# EasyEDA Pro project bike-tp.eprj

# Schematic Schematic1

## Sheets
1 P1: Board Name: Board1; Create Date: 2024-08-08; Page Name: P1; Project Name: bike-tp; Schematic Name: Schematic1; Update Date: 2025-05-04; Company: 嘉立创EDA; Page Size: A4; Version: V1.0
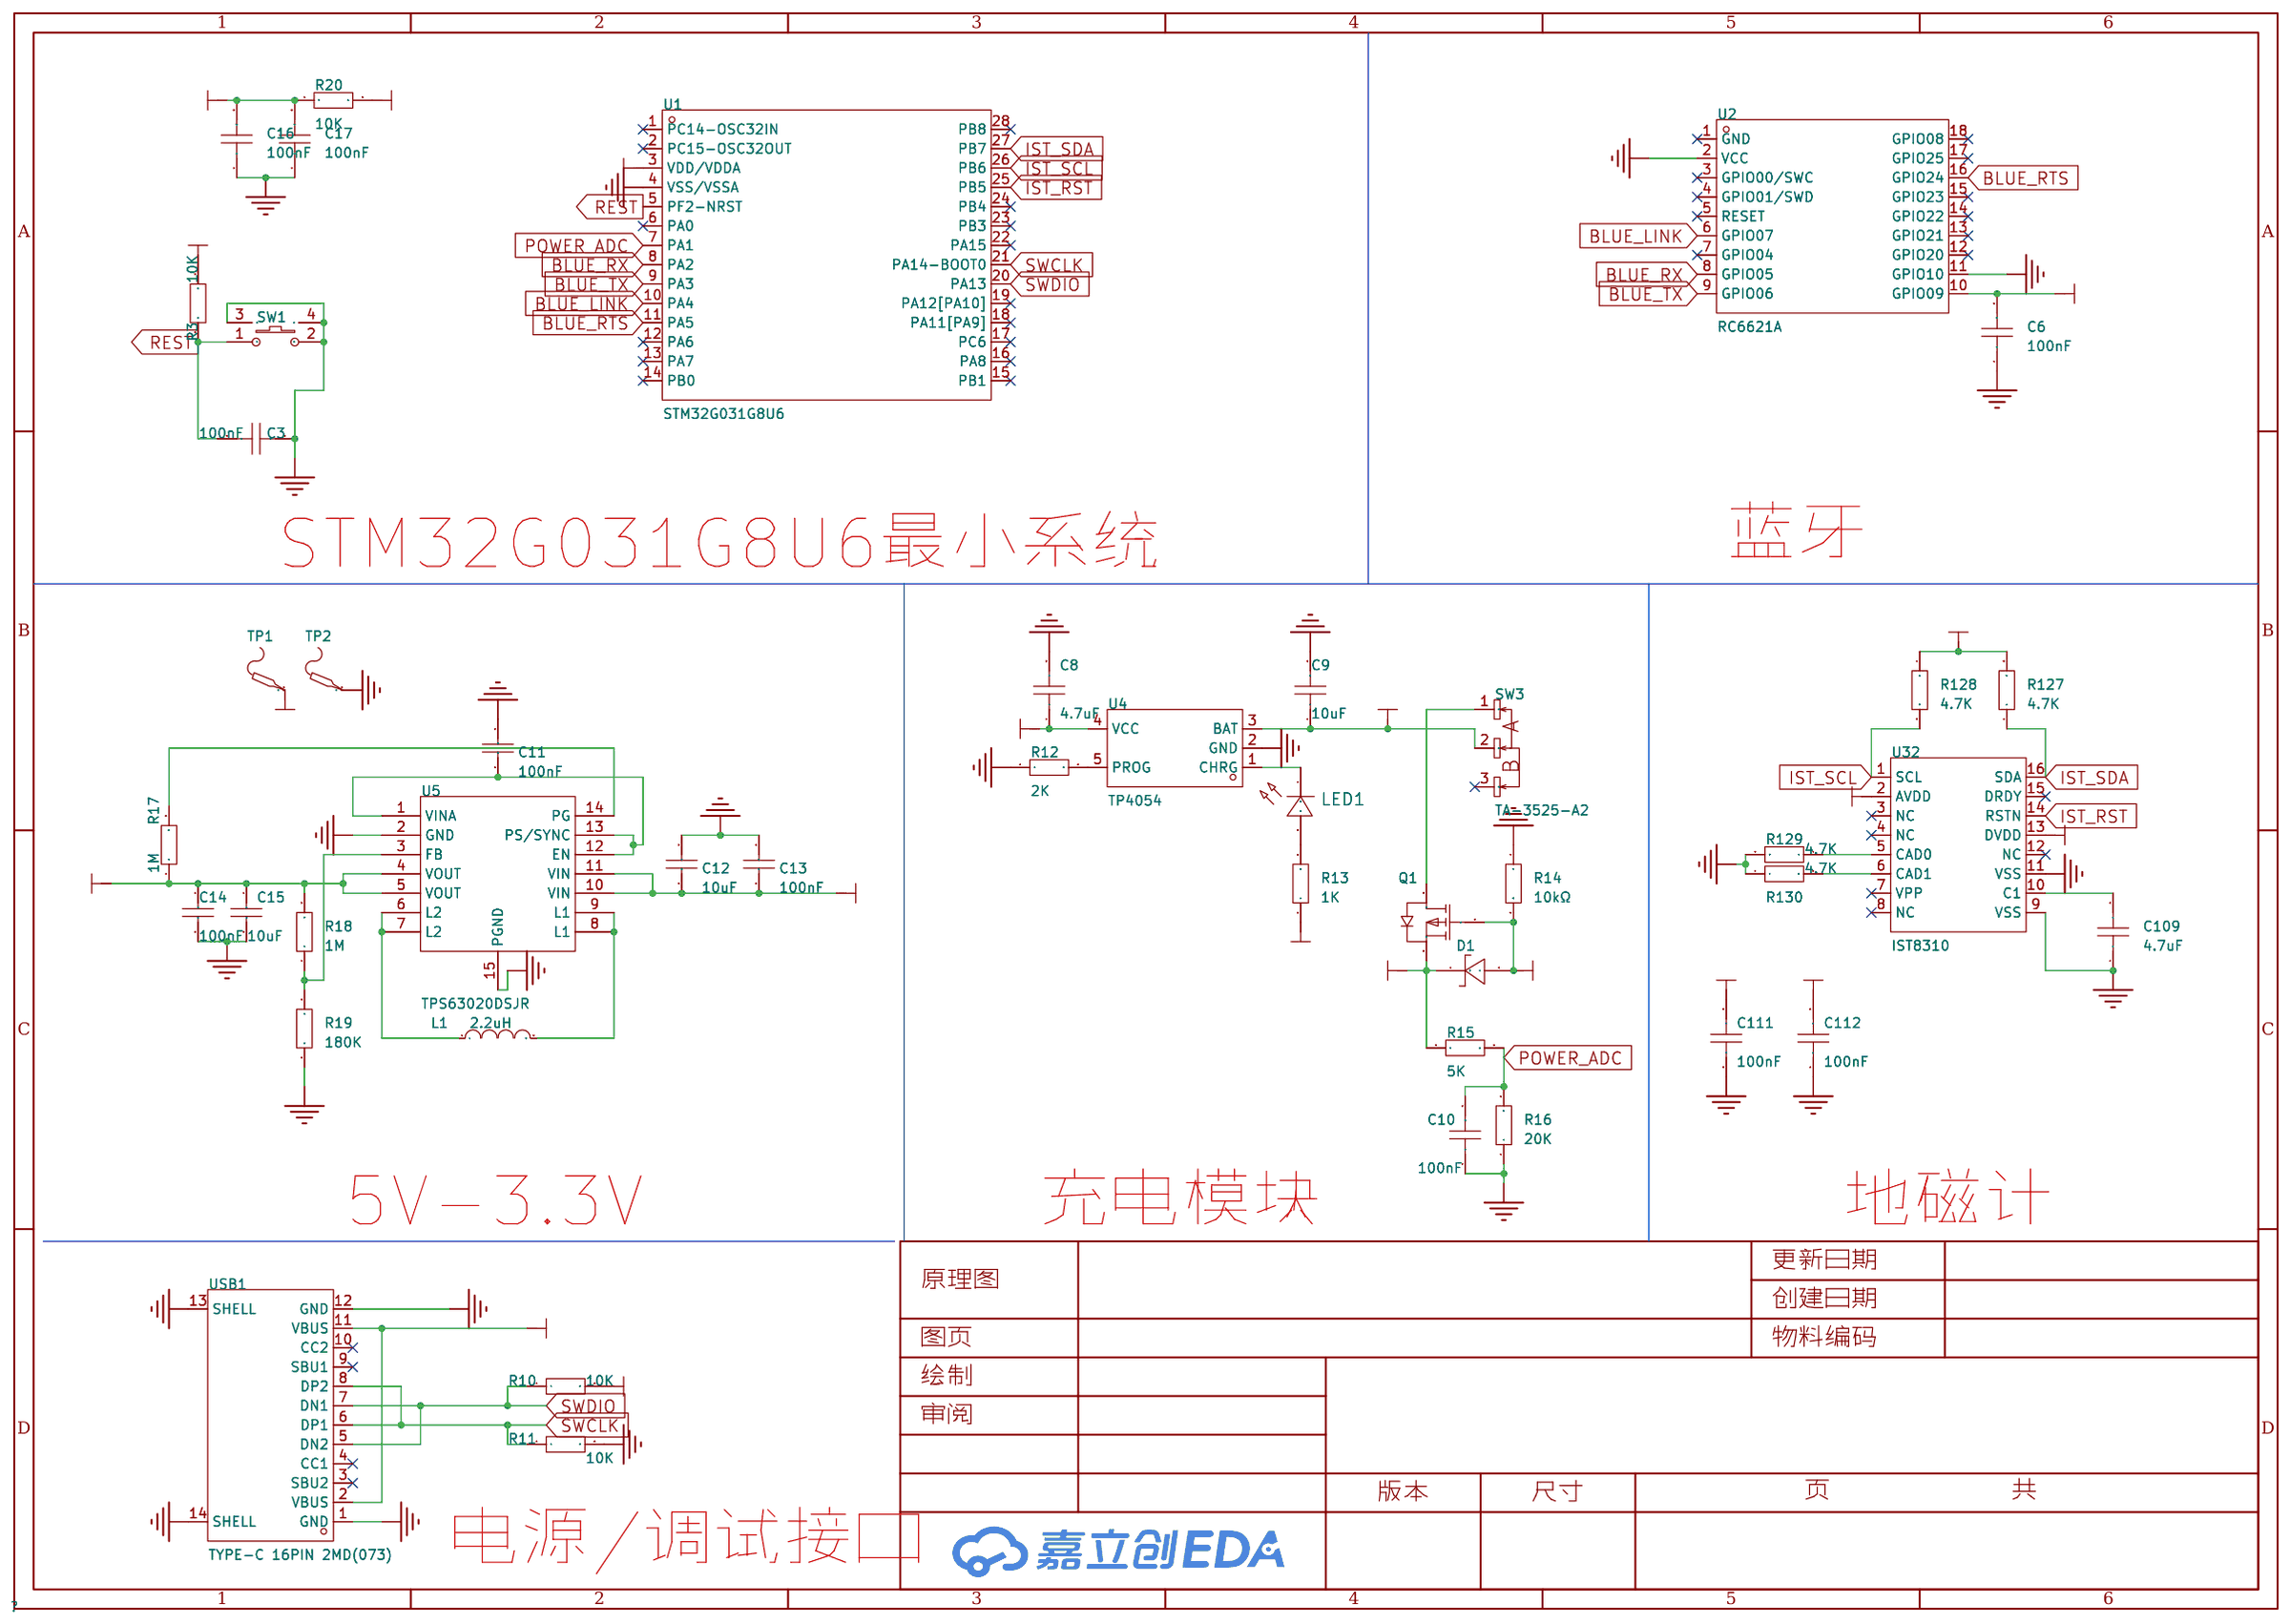
[diagram p0: P1]
2 power: Create Date: 2025-04-05; Page Name: power
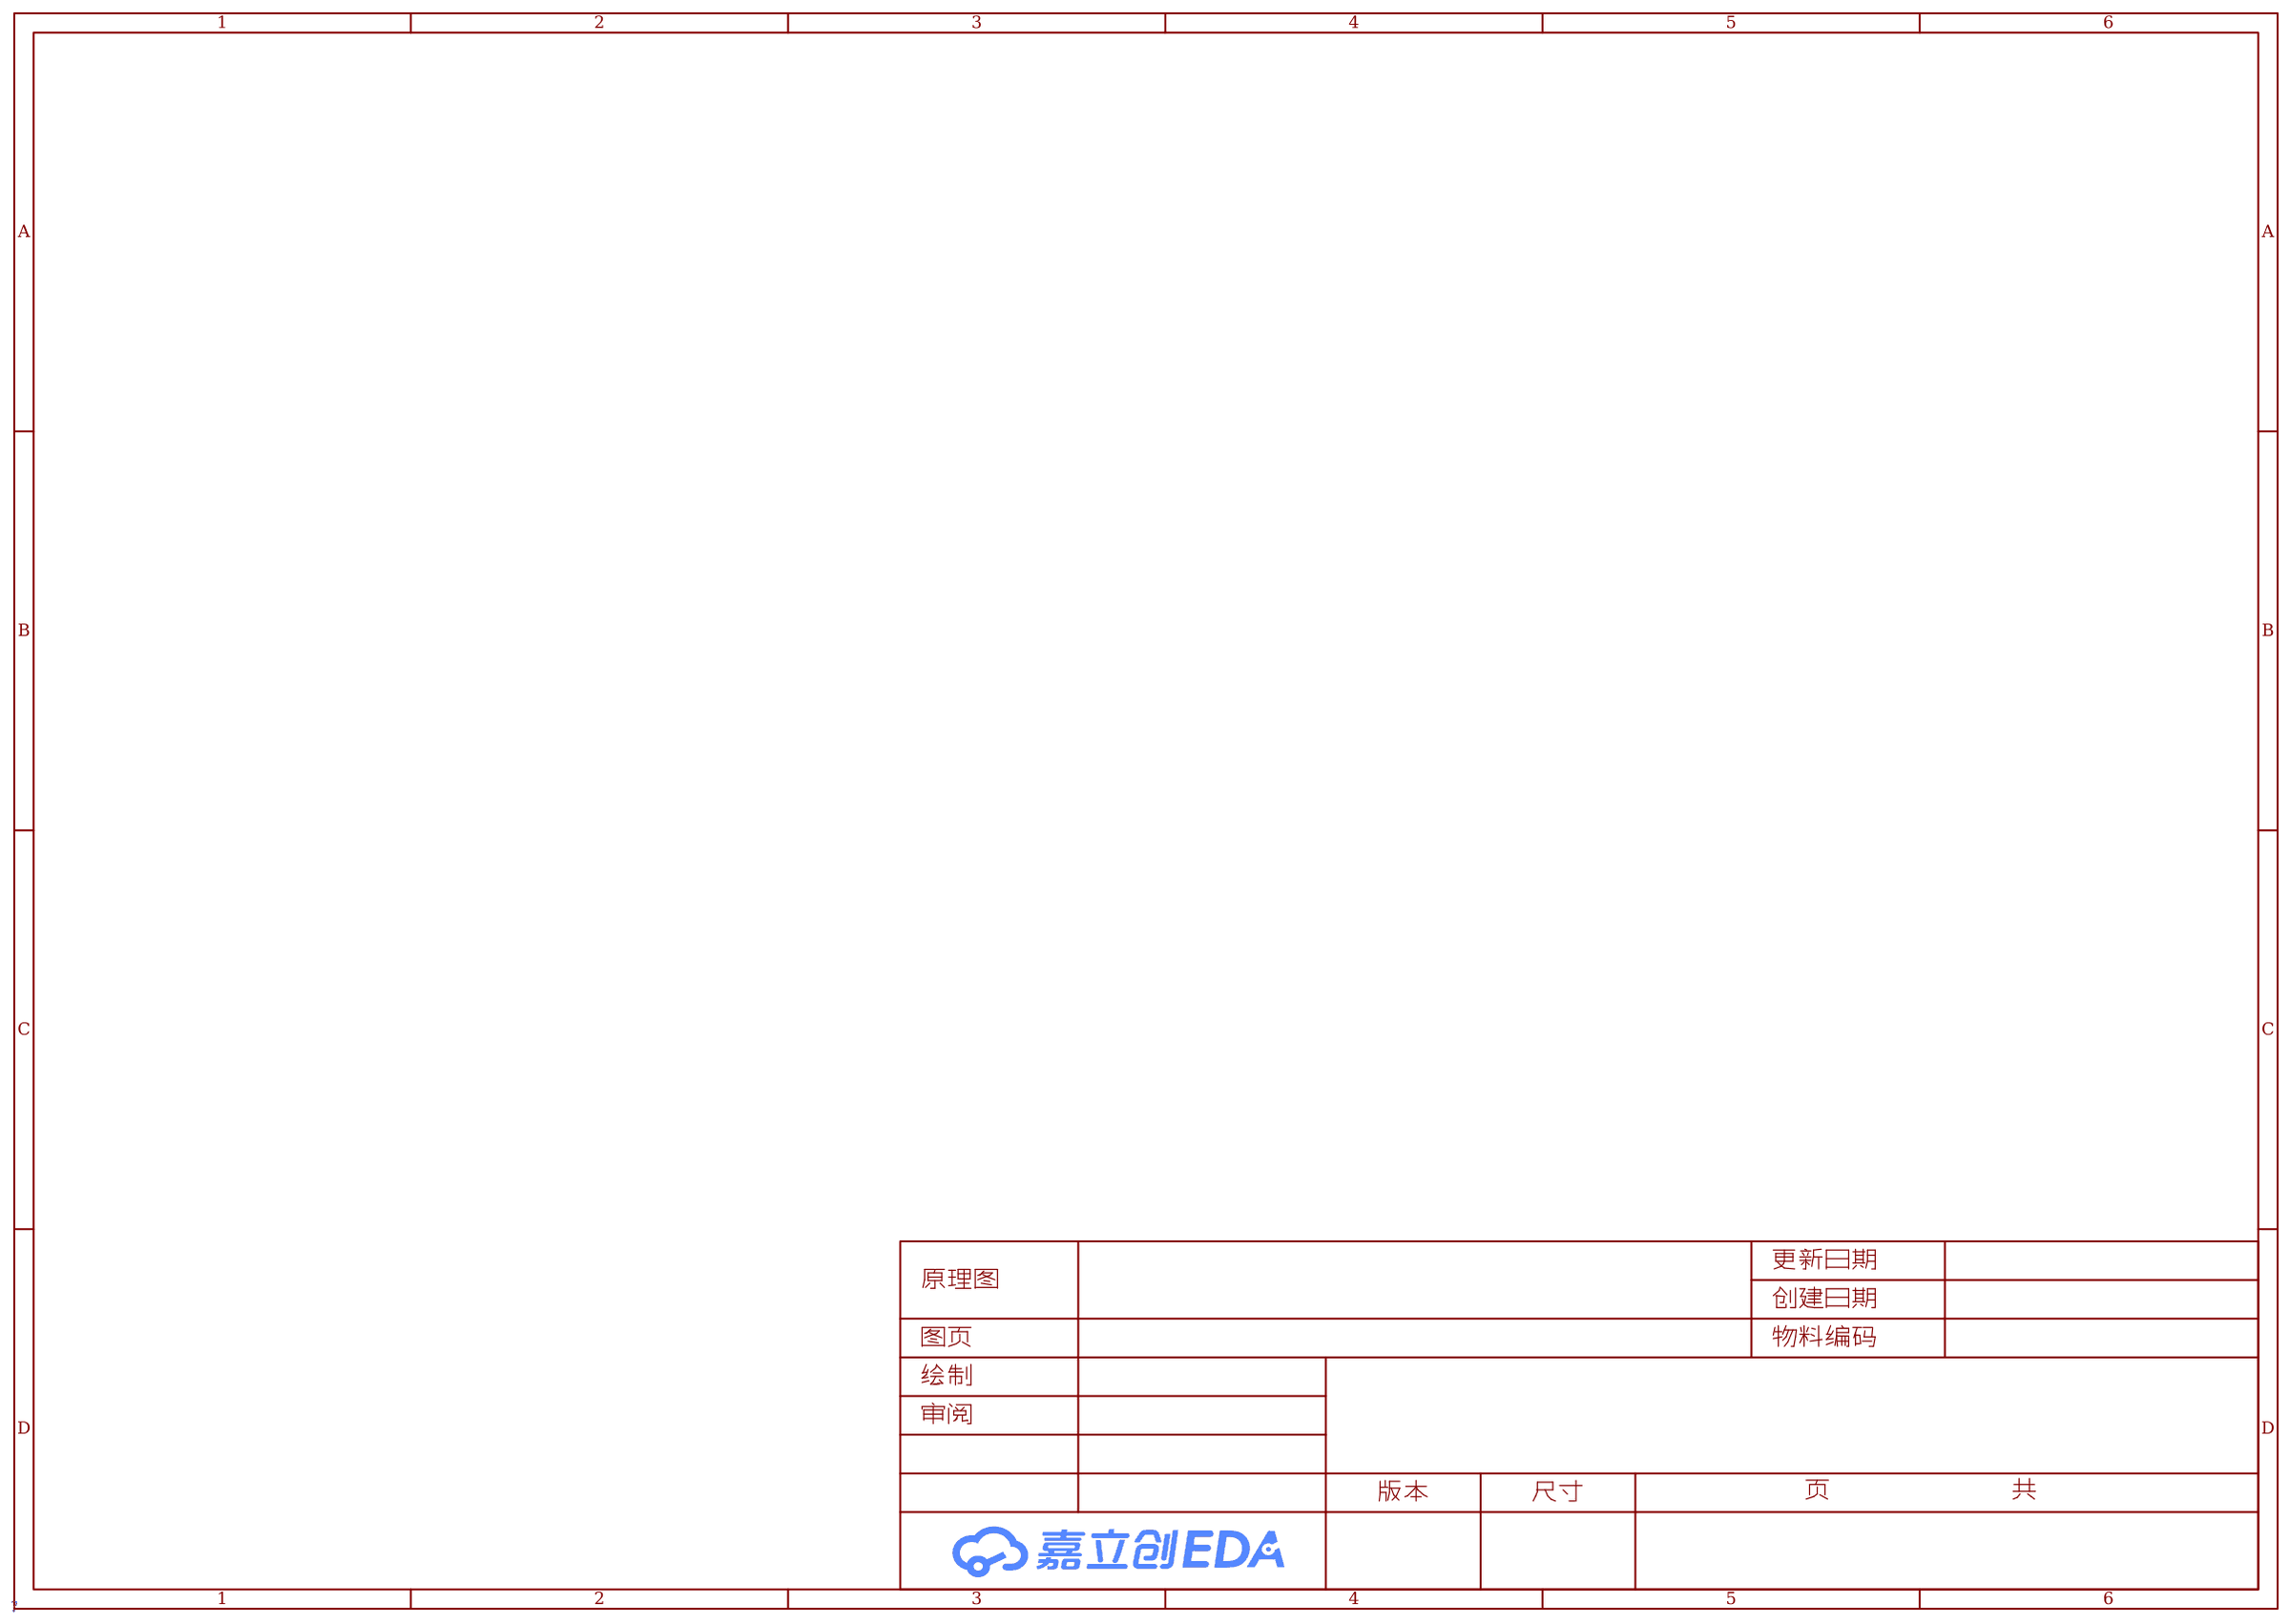
[diagram p1: power]

## Parts
C3  100nF  [C0603]
C6  100nF  [C0603]
C8  4.7uF  [C0603]
C9  10uF  [C0603]
C10  100nF  [C0603]
C11  100nF  [C0603]
C12  10uF  [C0603]
C13  100nF  [C0603]
C14  100nF  [C0603]
C15  10uF  [C0603]
C16  100nF  [C0603]
C17  100nF  [C0603]
C109  4.7uF  [C0603]
C111  100nF  [C0603]
C112  100nF  [C0603]
D1  1N5819WS  [SOD-323_L1.8-W1.3-LS2.5-RD]
L1  2.2uH  [IND-SMD_L4.4-W4.2]
LED1  -  [LED_0603]
Q1  AO3401A  [SOT-23_L2.9-W1.3-P1.90-LS2.4-BR]
R3  10K  [R0603]
R10  10K  [R0603]
R11  10K  [R0603]
R12  2K  [R0603]
R13  1K  [R0603]
R14  10kΩ  [R0603]
R15  5K  [R0603]
R16  20K  [R0603]
R17  1M  [R0603]
R18  1M  [R0603]
R19  180K  [R0603]
R20  10K  [R0603]
R127  4.7K  [R0603]
R128  4.7K  [R0603]
R129  4.7K  [R0603]
R130  4.7K  [R0603]
SW1  TS24CA 250gf 013  [SW-SMD_L4.7-W3.5-P3.35-EH]
SW3  TA-3525-A2  [SW-SMD_3P-L9.1-W3.5-P2.50-EH6.8]
TP1  -  [Test-Point-0.5mm]
TP2  -  [Test-Point-0.5mm]
U1  STM32G031G8U6  [UFQFPN-28_L4.0-W4.0-P0.50-BL]
U2  RC6621A  [BULETM-SMD_18P-L15.2-W11.2-P1.27]
U4  TP4054  [TSOT-23-5_L2.9-W1.6-P0.95-LS2.8-BR]
U5  TPS63020DSJR  [VSON-14_L4.0-W3.0-P0.50-BL-EP_TI_DSJ]
U32  IST8310  [LGA-16_L3.0-W3.0-P0.50-BL_SQ]
USB1  TYPE-C 16PIN 2MD(073)  [USB-C-SMD_TYPE-C-6PIN-2MD-073]

## Library data of the parts
C3 C6 C8-C10 C16 C17 C109 C111 C112 = CAP_0603: Supplier Footprint: 0603
C11 C13 C14 = CC0603KRX7R9BB104: 容值:100nF;精度:±10%;额定电压:50V;材质(温度系数):X7R;; LCSC Part Name: 100nF ±10% 50V; Supplier Part: C14663; Manufacturer: YAGEO(国巨); Supplier Footprint: 0603; JLCPCB Part Class: Basic Part; Datasheet: https://atta.szlcsc.com/upload/public/pdf/source/20180910/C282072_33301C7F631E79921B82A8DAC6BCC5B3.pdf; Supplier: LCSC; Tolerance: ±10%; Voltage Rated: 50V; Temperature Coefficient: X7R
C12 C15 = CL10A106MA8NRNC: 容值:10uF;精度:±20%;额定电压:25V;材质(温度系数):X5R;; LCSC Part Name: 10uF ±20% 25V; Supplier Part: C96446; Manufacturer: SAMSUNG(三星); Supplier Footprint: 0603; JLCPCB Part Class: 基础库; Datasheet: https://atta.szlcsc.com/upload/public/pdf/source/20170325/1490427913016.pdf; Supplier: LCSC; Tolerance: ±20%; Voltage Rated: 25V; Temperature Coefficient: X5R
D1 = 1N5819WS_C191023: 直流反向耐压(Vr):40V;平均整流电流(Io):1A;正向压降(Vf):600mV@1A;; LCSC Part Name: 40V1A600mV@1A; Supplier Part: C191023; Manufacturer: Hottech(合科泰); Supplier Footprint: SOD-323; JLCPCB Part Class: BasicPart; Datasheet: https://atta.szlcsc.com/upload/public/pdf/source/20220428/3CB86FD8D28D653594B4E35F9D5AEFD9.pdf; Supplier: LCSC; Reverse Voltage (Vr): 40V; Average Rectified Current (Io): 1A; Forward Voltage (Vf@If): 600mV@1A
L1 = FXL0420-4R7-M: 电感值:4.7uH;精度:±20%;额定电流:2.8A;饱和电流(Isat):3A;类型:一体成型电感;; LCSC Part Name: 4.7uH ±20% 3A; Supplier Part: C167208; Manufacturer: cjiang(长江微电); Supplier Footprint: SMD,4.2x4.4mm; JLCPCB Part Class: 扩展库; Datasheet: https://atta.szlcsc.com/upload/public/pdf/source/20240426/3189EA8206330E2108542F9E34E540E7.pdf; Supplier: LCSC; Tolerance: ±20%; Rated Current: 2.8A; Saturation Current (Isat): 3A; DC Resistance (DCR): 105mΩ; Type: 一体成型电感
LED1 = LED_0603-R: Supplier Footprint: 0603
Q1 = AO3401A_C15127: 类型:P沟道;漏源电压(Vdss):30V;连续漏极电流(Id):4A;功率(Pd):1.4W;导通电阻(RDS(on)@Vgs,Id):44mΩ@10V,4.3A;; LCSC Part Name: P沟道30V4A; Supplier Part: C15127; Manufacturer: AOS; Supplier Footprint: SOT-23-3L; JLCPCB Part Class: BasicPart; Datasheet: https://atta.szlcsc.com/upload/public/pdf/source/20160507/1462613609053.pdf; Supplier: LCSC; Type: P沟道; Drain Source Voltage (Vdss): 30V; Continuous Drain Current (Id): 4A; Power Dissipation (Pd): 1.4W; Drain Source On Resistance (RDS(on)@Vgs,Id): 44mΩ@10V,4.3A; Gate Threshold Voltage (Vgs(th)@Id): 1.3V@250uA
R3 R10-R13 R15-R20 R127-R130 = Res_0603: Supplier Footprint: 0603
R14 = 0603WAF1002T5E: 电阻类型:厚膜电阻;阻值:10kΩ;精度:±1%;功率:100mW;; LCSC Part Name: 厚膜电阻 10kΩ ±1% 100mW; Supplier Part: C25804; Manufacturer: UNI-ROYAL(厚声); Supplier Footprint: 0603; JLCPCB Part Class: 基础库; Datasheet: https://atta.szlcsc.com/upload/public/pdf/source/20200306/C422600_1E6D84923E4A46A82E41ADD87F860B5C.pdf; Supplier: LCSC; Type: 厚膜电阻; Tolerance: ±1%; Power(Watts): 100mW; Temperature Coefficient: ±100ppm/℃; Overload Voltage (Max): 75V; Operating Temperature Range: -55℃~+155℃
SW1 = TS24CA 250gf 013: 电路结构:单刀单掷;按钮形状:矩形按钮;作用力:250gf;安装方式:卧贴;开关长度:4.55mm;开关宽度:1.8mm;开关高度:3.5mm;带支架:不带;触点电流:50mA;额定电压(AC):-;额定电压(DC):12V;额定功率:0.6W;绝缘电阻:100MΩ;带灯:无;机械寿命:3万次;; LCSC Part Name: 2*4*3.5mm半包小贝贝TS-018小侧按键m165蓝牙耳机开关 250gf; Supplier Part: C5373430; Manufacturer: SHOU HAN(首韩); Supplier Footprint: SMD; JLCPCB Part Class: 扩展库; Datasheet: https://atta.szlcsc.com/upload/public/pdf/source/20230321/913029B0FB0CD391AF5EFD51697D8EC4.pdf; Supplier: LCSC; Circuit: 单刀单掷; Actuator Style: 矩形按钮; Operating Force: 250gf; Mounting Style: 卧贴; Switch Length: 4.55mm; Switch Width: 1.8mm; Switch Height: 3.5mm; Strike Gundam: 不带; Contact Current: 50mA; Voltage Rating (DC): 12V; Power Rating: 0.6W; Insulation Resistance: 100MΩ; Actuator/Cap Color: 黑色; With Lamp: 无; Mechanical Life: 3万次; Operating Temperature: -40℃~+85℃
SW3 = TA-3525-A2: LCSC Part Name: 滑动开关9.1*3.5*3.0mm贴片侧拨单排三脚二档; Supplier Part: C514019; Manufacturer: Yuandi(元迪); Supplier Footprint: SMD,3.5x9.1mm; JLCPCB Part Class: 扩展库; Datasheet: https://atta.szlcsc.com/upload/public/pdf/source/20200415/C514019_BD29F4555739DB2630A1255040CB70C0.pdf; Supplier: LCSC
TP1 TP2 = Test-Point: Test Point 测试点
U1 = STM32G031G8U6: LCSC Part Name: 主流Arm Cortex-M0+ MCU，具有64 KB Flash存储器、8 KB RAM、64 MHz CPU、2x USART、定时器、ADC和通信接口，1.7-3.6V; Supplier Part: C432211; Manufacturer: ST(意法半导体); Supplier Footprint: UFQFPN-28(4x4); JLCPCB Part Class: 扩展库; Datasheet: https://atta.szlcsc.com/upload/public/pdf/source/20190927/C432211_623EEFA1D407096BEEBF7364175DF17E.pdf; Supplier: LCSC; CPU Core: ARM-M系列; CPU Maximum Speed: 64MHz; Program Storage Size: 64KB; Program Memory Type: FLASH; Number of I/O: 26; ADC (Bit): 12bit; Low Voltage Detection Threshold: 1.7V~3.6V
U2 = RC6621A: 核心芯片:HS6621A芯片;支持接口:UART;最大发射功率:6dBm;通讯距离:20m~100m;接收灵敏度:-94dBm;; LCSC Part Name: 蓝牙5.2 BLE透传模块; Supplier Part: C2886280; Manufacturer: RF Crazy(智汉); Supplier Footprint: SMD,11x15mm; JLCPCB Part Class: 扩展库; Datasheet: https://atta.szlcsc.com/upload/public/pdf/source/20230407/49E21971C810D795DE5D434EE457DEDA.pdf; Supplier: LCSC; Core  IC: HS6621A芯片; Support Interface: UART; Output Power  (Max): 6dBm; Operating Voltage: 2V~3.6V; Receive  Current: 3.8mA; Send  Current: 8mA; Communication Distance: 20m~100m; Sensitivity: -94dBm; Operating Temperature: -30℃~+85℃
U4 = TP4054_C668215: Supplier Part: C668215; Manufacturer: UMW(友台半导体); Supplier Footprint: SOT-23-5L; JLCPCB Part Class: 扩展库; Datasheet: https://atta.szlcsc.com/upload/public/pdf/source/20231109/1E60770826C4E1A0E5898BBC08FF3A57.pdf; Supplier: LCSC; Supply Voltage: 6.5V; Maximum Charge Current: 500mA; Type of Battery: 锂离子/聚合物; Number of Cells: 1; Operating Temperature: -40℃~+85℃
U5 = TPS63020DSJR: 功能类型:升降压型;输出类型:可调;输入电压:1.8V~5.5V;输出电压:1.2V~5.5V;输出电流(最大值):3.5A;; Supplier Part: C15483; Manufacturer: TI(德州仪器); Supplier Footprint: VSON-14-EP(3x4); JLCPCB Part Class: 扩展库; Datasheet: https://www.ti.com/cn/lit/gpn/tps63020; Supplier: LCSC; Function: 升降压型; Output Type: 可调; Input Voltage: 1.8V~5.5V; Output Voltage: 1.2V~5.5V; Output Current (Max): 3.5A; Switching Frequency: 2.4MHz; Operating Temperature: -40℃~+85℃@(TA); Synchronous Rectification: 是; Number of Outputs: 1; Topology: 降压-升压式; Switch tube (built-in/external): 内置
U32 = IST8310_C2683055: Supplier Part: C2683055; Manufacturer: iSentek(爱盛科技); Supplier Footprint: LGA-16(3x3); JLCPCB Part Class: 扩展库; Datasheet: https://atta.szlcsc.com/upload/public/pdf/source/20250224/70FB1E25A3B1BEF4BDD1315496E152E4.pdf; Supplier: LCSC
USB1 = TYPE-C 16PIN 2MD(073): 连接器类型:Type-C;标准:USB 3.1;公母:母;安装方式:卧贴;触点数量:16P;端口数量:1;额定电流 - 电源:5A;工作温度范围:-25℃~+85℃;; LCSC Part Name: Type-C 母 卧贴; Supplier Part: C2765186; Manufacturer: SHOU HAN(首韩); Supplier Footprint: SMD; JLCPCB Part Class: 扩展库; Datasheet: https://atta.szlcsc.com/upload/public/pdf/source/20211123/39B17C16241EAC15C5E277BDA434118E.pdf; Supplier: LCSC; Connector Type: Type-C; Standard: USB 3.1; Gender: 母; Mounting Style: 卧贴; Number of Contacts: 16P; Number of Ports: 1; Current Rating - Power (Max): 5A; Operating Temperature Range: -25℃~+85℃; Rated Voltage (Max): 5V; Connect-Disconnect Life: 5千次; Core Colour: 黑色

## Nets
5V: C12.1 C13.1 D1.1(C) Q1.2(S) R15.1 U5.10(VIN) U5.11(VIN)
GND: C3.1 C6.1 C8.2 C9.2 C10.1 C11.2 C12.2 C13.2 C14.2 C15.2 C16.1 C17.1 C109.1 C111.1 C112.1 R11.2 R12.1 R14.1 R16.1 R19.1 R129.2 R130.1 SW1.2 SW1.3 SW1.4 TP2.1 U1.4(VSS/VSSA) U2.2(VCC) U2.11(GPIO10) U4.2(GND) U5.2(GND) U5.15(PGND) U32.9(VSS) U32.11(VSS) USB1.1(GND) USB1.12(GND) USB1.13(SHELL) USB1.14(SHELL)
VBAT: C9.1 SW3.2 TP1.1 U4.3(BAT)
VBUS: C8.1 D1.2(A) Q1.1(G) R13.1 R14.2 U4.4(VCC) USB1.2(VBUS) USB1.11(VBUS)
VCC3V3: C6.2 C14.1 C15.1 C111.2 C112.2 R3.2 R10.2 R17.1 R18.2 R20.2 R127.2 R128.1 U2.10(GPIO09) U5.4(VOUT) U5.5(VOUT) U32.2(AVDD) U32.13(DVDD)
VDDA: C16.2 C17.2 R20.1 U1.3(VDD/VDDA)
BLUE_LINK: U1.10(PA4) U2.6(GPIO07)
BLUE_RTS: U1.11(PA5) U2.16(GPIO24)
BLUE_RX: U1.8(PA2) U2.8(GPIO05)
BLUE_TX: U1.9(PA3) U2.9(GPIO06)
IST_RST: U1.25(PB5) U32.14(RSTN)
IST_SCL: R128.2 U1.26(PB6) U32.1(SCL)
IST_SDA: R127.1 U1.27(PB7) U32.16(SDA)
POWER_ADC: C10.2 R15.2 R16.2 U1.7(PA1)
REST: C3.2 R3.1 SW1.1 U1.5(PF2-NRST)
SWCLK: R11.1 U1.21(PA14-BOOT0) USB1.6(DP1) USB1.8(DP2)
SWDIO: R10.1 U1.20(PA13) USB1.5(DN2) USB1.7(DN1)
$1N9447: C109.2 U32.10(C1)
$1N9455: R129.1 U32.5(CAD0)
$1N9456: R130.2 U32.6(CAD1)
$2N1610: Q1.3(D) SW3.1
$2N2157: LED1.1(C) U4.1(CHRG)
$2N2861: R18.1 R19.2 U5.3(FB)
$2N2863: C11.1 U5.1(VINA) U5.12(EN) U5.13(PS/SYNC)
$2N2864: R17.2 U5.14(PG)
$2N2865: L1.2 U5.8(L1) U5.9(L1)
$2N2870: L1.1 U5.6(L2) U5.7(L2)
$2N2929: R12.2 U4.5(PROG)
$2N2958: LED1.2(A) R13.2

Not connected (* = marked no-connect by the designer): SW3 3*; U1 1(PC14-OSC32IN)* 2(PC15-OSC32OUT)* 6(PA0)* 12(PA6)* 13(PA7)* 14(PB0)* 15(PB1)* 16(PA8)* 17(PC6)* 18(PA11[PA9])* 19(PA12[PA10])* 22(PA15)* 23(PB3)* 24(PB4)* 28(PB8)*; U2 1(GND)* 3(GPIO00/SWC)* 4(GPIO01/SWD)* 5(RESET)* 7(GPIO04)* 12(GPIO20)* 13(GPIO21)* 14(GPIO22)* 15(GPIO23)* 17(GPIO25)* 18(GPIO08)*; U32 3(NC)* 4(NC)* 7(VPP)* 8(NC)* 12(NC)* 15(DRDY)*; USB1 3(SBU2)* 4(CC1)* 9(SBU1)* 10(CC2)*

## Notes on the sheets
sheet 1
- 蓝牙
- STM32G031G8U6最小系统
- 5V-3.3V
- 充电模块
- 地磁计
- 电源/调试接口

# Board PCB1
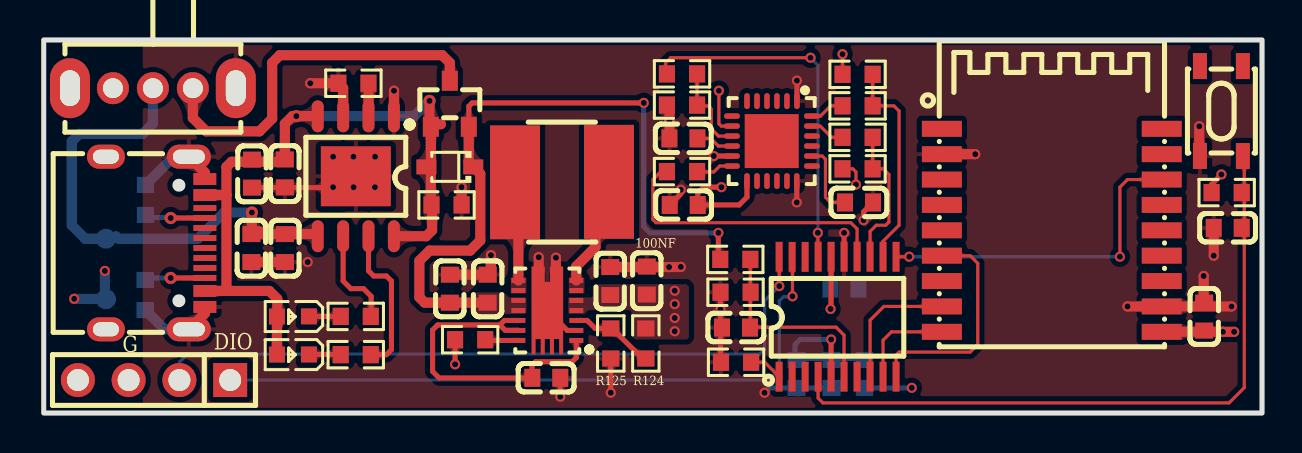
[diagram p2: board, top side]
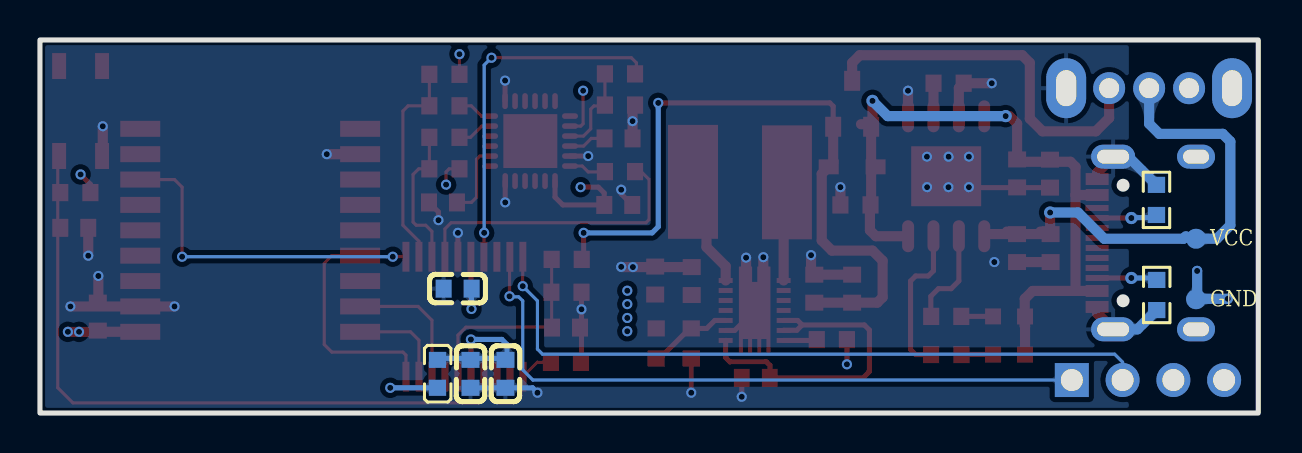
[diagram p3: board, bottom side, seen from below]

Outline 60.96 x 18.67 mm; copper layers: Top Layer, Inner1, Inner2, Bottom Layer. Coordinates in mm from the lower left corner of the outline.
Outline path: rectangle 0,18.67 60.96,0
Stack: Top Layer 0.035mm 外层铜厚1oz / Dielectric1 0.2104mm 7628 RC49% 8.6mil / Inner1 0.0152mm 内层铜厚 / Dielectric2 1.065mm 1.1mm H/HOZ 含铜 / Inner2 0.0152mm 内层铜厚 / Dielectric3 0.2104mm 7628 RC49% 8.6mil / Bottom Layer 0.035mm 外层铜厚1oz

## Design rules (mm)
template: JLCPCB Capability(Two Layers Board)
spacing copperThickness1oz (default): track to track 0.102, other pairs 0.152 to 0.3
spacing copperThickness2oz: track to track 0.203, other pairs 0.152 to 0.3
track width copperThickness1oz (default): min 0.127, default 0.254, max 2.54
track width copperThickness2oz: min 0.203, default 0.254, max 2.54
differential pair differentialPair (default): width min 0.127, default 0.254, max 2.54; gap min 0.152, default 0.152
via viaSize (default): diameter min 0.5, default 0.61, max 10; hole min 0.3, default 0.305, max 6.3

## Placement (name value [footprint] x y rotation side)
100NF  10uF  [C0603]  28.35 6.6 90 top
C3  100nF  [C0603]  37.67 1.96 270 bottom
C4  2.2UF  [C0603]  39.42 1.96 270 bottom
C25  10uF  [C0603]  12.07 11.99 90 top
C26  100nF  [C0603]  10.42 11.98 90 top
C27  10uF  [C0603]  10.39 8.25 90 top
C28  100nF  [C0603]  12.07 8.25 90 top
C32  1uF  [C0603]  59.24 9.27 0 top
C82  100nF  [C0603]  32.01 13.74 0 top
C83  10uF  [C0603]  40.79 10.54 0 top
C84  100nF  [C0603]  32.02 10.41 0 top
C85  100nF  [C0603]  58.07 4.83 270 top
C86  100nF  [C0603]  40.06 6.22 180 bottom
C96  100nF  [C0603]  34.64 4.28 0 top
C99  100nF  [C0603]  22.21 6.22 90 top
C100  10uF  [C0603]  20.32 6.22 90 top
C101  100nF  [C0603]  25.15 1.76 0 top
C102  100nF  [C0603]  30.17 6.63 90 top
D1  1N5819WS  [SOD-323_L1.8-W1.3-LS2.5-RD]  20.32 12.32 180 top
H1  -  [HDR-TH_4P-P2.54-V-M]  5.52 1.65 180 top
L3  MPZ1608S181ATAH0  [L0603]  41.07 1.96 270 bottom
L8  2.2uH  [IND-SMD_L6.0-W6.0_FNR60XXS]  25.93 11.56 180 top
LED2  -  [LED_0603]  12.42 2.92 180 top
LED3  -  [LED_0603]  12.42 4.83 180 top
Q1  AO3401A  [SOT-23_L2.9-W1.3-P1.90-LS2.4-BR]  20.32 15.48 270 top
R3  10kΩ  [R0603]  15.49 16.5 0 top
R4  10kΩ  [R0603]  20.15 10.41 180 top
R25  10K  [R0603]  59.19 11.03 180 top
R91  680R  [R0603]  15.61 2.92 180 top
R92  680R  [R0603]  15.61 4.84 180 top
R93  120R  [R0603]  40.72 15.37 0 top
R94  120R  [R0603]  40.72 13.8 0 top
R95  4.7K  [R0603]  40.72 16.95 180 top
R96  4.7K  [R0603]  40.72 12.22 180 top
R97  120R  [R0603]  31.94 12.08 0 top
R98  120R  [R0603]  31.94 16.97 0 top
R99  10K  [R0603]  31.94 15.41 180 top
R113  5K  [R0603]  34.6 7.69 0 top
R114  20K  [R0603]  34.62 6.05 0 top
R120  5.1K  [R0603]  5.09 10.67 90 bottom
R121  5.1K  [R0603]  5.08 5.91 270 bottom
R122  10kΩ  [R0603]  34.64 2.54 180 top
R123  1M  [R0603]  21.34 3.67 0 top
R124  1M  [R0603]  30.13 3.48 90 top
R125  180K  [R0603]  28.37 3.48 90 top
SW2  SK12D07VG5  [SW-TH_SK12D07VG5]  5.46 16.26 180 top
SW3  TS-1089S-02526  [SW-SMD_4P-L4.2-W3.3-P2.15-LS5.1]  58.93 15.11 90 top
TP10  -  [test-point-0.5mm]  3.11 8.72 90 top
TP11  -  [test-point-0.5mm]  3.11 5.69 90 top
U1  STM32F030F4P6TR  [SOP-20_L6.5-W4.4-P0.65-LS6.4-BL]  39.72 4.82 0 top
U11  TP4056X-42-ESOP8  [SOP-8_L4.9-W3.9-P1.27-LS6.0-TL-EP]  15.62 11.85 270 top
U21  RC6621A  [BULETM-SMD_18P-L15.2-W11.2-P1.27]  50.44 9.14 0 top
U22  MPU-6050  [QFN-24_L4.0-W4.0-P0.50-BL-EP2.7]  36.44 13.61 180 top
U29  TPS63020DSJR  [VSON-14_L4.0-W3.0-P0.50-BL-EP_TI_DSJ]  25.2 5.13 90 top
USB2  CQ-USB-TYPE-C16P母座四脚插板有柱  [USB-C-SMD_CQ-USB-TYPE-C]  5.59 8.51 270 top

## Footprints (pads in the part's own frame, mm; a bottom-side part is the same pattern mirrored in y, then rotated)
BULETM-SMD_18P-L15.2-W11.2-P1.27
  rect 2x0.8 smd: 1(-5.5,5.08) 2(-5.5,3.81) 3(-5.5,2.54) 4(-5.5,1.27) 5(-5.5,0) 6(-5.5,-1.27) 7(-5.5,-2.54) 8(-5.5,-3.81) 9(-5.5,-5.08) 10(5.5,-5.08) 11(5.5,-3.81) 12(5.5,-2.54) 13(5.5,-1.27) 14(5.5,0) 15(5.5,1.27) 16(5.5,2.54) 17(5.5,3.81) 18(5.5,5.08)
C0603
  rect 0.8x0.9 smd: 1(-0.7,0) 2(0.7,0)
HDR-TH_4P-P2.54-V-M
  rect 1.7x1.7 hole 1.1: 1(-3.81,0)
  round 1.7 hole 1.1: 2(-1.27,0) 3(1.27,0) 4(3.81,0)
IND-SMD_L6.0-W6.0_FNR60XXS
  rect 2.5x5.7 smd: 1(-2.35,-0.013) 2(2.35,0.013)
L0603
  rect 0.8x0.864 smd: 1(-0.7,0) 2(0.7,0)
LED_0603
  rect 0.8x0.8 smd: 1(-0.851,-0.01) 2(0.75,-0.005)
QFN-24_L4.0-W4.0-P0.50-BL-EP2.7
  oval 0.28x0.8 smd: 1(-1.25,-2) 2(-0.75,-2) 3(-0.25,-2) 4(0.25,-2) 5(0.75,-2) 6(1.25,-2) 13(1.25,2) 14(0.75,2) 15(0.25,2) 16(-0.25,2) 17(-0.75,2) 18(-1.242,2)
  oval 0.8x0.28 smd: 7(2,-1.25) 8(2,-0.75) 9(2,-0.25) 10(2,0.25) 11(2,0.75) 12(2,1.25) 19(-2,1.25) 20(-2,0.75) 21(-2,0.25) 22(-2,-0.25) 23(-2,-0.75) 24(-2,-1.25)
  rect 2.7x2.7 smd: 25(0.013,0)
R0603
  rect 0.806x0.864 smd: 1(-0.753,0) 2(0.753,0)
SOD-323_L1.8-W1.3-LS2.5-RD
  rect 1x0.75 smd: 1(-1.173,0) 2(1.173,0)
SOP-8_L4.9-W3.9-P1.27-LS6.0-TL-EP
  oval 1.6x0.6 smd: 1(-3,1.905) 2(-3,0.635) 3(-3,-0.635) 4(-3,-1.905) 5(3,-1.905) 6(3,-0.635) 7(3,0.635) 8(3,1.905)
  rect 3x3.5 smd: 9(0,0)
SOP-20_L6.5-W4.4-P0.65-LS6.4-BL
  rect 0.35x1.494 smd: 1(-2.925,-3.001) 2(-2.275,-3.001) 3(-1.625,-3.001) 4(-0.975,-3.001) 5(-0.325,-3.001) 6(0.324,-3.001) 7(0.975,-3.001) 8(1.625,-3.001) 9(2.275,-3.001) 10(2.925,-3.001) 11(2.925,3.001) 12(2.275,3.001) 13(1.625,3.001) 14(0.975,3.001) 15(0.325,3.001) 16(-0.325,3.001) 17(-0.975,3.001) 18(-1.625,2.996) 19(-2.275,2.996) 20(-2.925,3.001)
SOT-23_L2.9-W1.3-P1.90-LS2.4-BR
  rect 1x0.8 smd: 1(1.15,-0.95) 2(1.15,0.95) 3(-1.15,0)
SW-SMD_4P-L4.2-W3.3-P2.15-LS5.1
  rect 1.3x0.7 smd: 1(-2.25,1.075) 2(2.25,1.075) 3(-2.25,-1.075) 4(2.25,-1.075)
SW-TH_SK12D07VG5
  oval 1.6x1.6 hole 1: 1(-2,0) 2(0,0) 3(2,0)
  oval 2x3 hole 1x1.8: 4(4.15,0) 5(-4.15,0)
test-point-0.5mm
  round 1 smd far side: 1(0,0)
USB-C-SMD_CQ-USB-TYPE-C
  oval 1.2x2.2 hole 0.7x1.6: 0(-4.32,1.675) 0(4.32,1.675)
  oval 1.2x1.9 hole 0.7x1.3: 0(-4.32,-2.475) 0(4.32,-2.475)
  rect 0.6x1.15 smd: A1B12(-3.2,2.471) A4B9(-2.4,2.471) B1A12(3.2,2.475) B4A9(2.4,2.475)
  rect 0.3x1.15 smd: A5(-1.25,2.475) A6(-0.25,2.475) A7(0.25,2.474) A8(1.25,2.475) B5(1.75,2.475) B6(0.75,2.475) B7(-0.75,2.473) B8(-1.75,2.475)
VSON-14_L4.0-W3.0-P0.50-BL-EP_TI_DSJ
  rect 0.25x0.7 smd: 1(-1.5,-1.45) 2(-1,-1.45) 3(-0.5,-1.45) 4(0,-1.45) 5(0.5,-1.45) 6(1,-1.45) 7(1.5,-1.45) 8(1.5,1.45) 9(1,1.45) 10(0.5,1.45) 11(0,1.45) 12(-0.5,1.45) 13(-1,1.45) 14(-1.5,1.45)
  custom 4.4x1.58 smd: 15(0,0)

## Nets
5V: C99.1 C100.1 D1.1 Q1.2 R113.1 U29.10 U29.11
GND: 100NF.2 C3.2 C4.2 C25.1 C26.1 C27.1 C28.1 C32.1 C82.1 C83.2 C84.1 C85.1 C86.1 C96.1 C99.2 C100.2 C101.2 C102.2 H1.3 R3.1 R4.1 R99.2 R114.1 R120.2 R121.2 R122.2 R125.1 SW2.4 SW2.5 SW3.1 TP11.1 U1.15 U11.1 U11.3 U11.9 U21.2 U21.11 U22.1 U22.11 U22.18 U29.2 U29.15 USB2.0 USB2.A1B12 USB2.B1A12
VBAT: C27.2 C28.2 SW2.2 TP10.1 U11.5
VBUS: C25.2 C26.2 D1.2 LED2.2 LED3.2 Q1.1 R4.2 U11.4 U11.8 USB2.A4B9 USB2.B4A9
VCC3V3: 100NF.1 C84.2 C85.2 C86.2 C102.1 H1.4 L3.2 R25.2 R95.2 R96.2 R123.1 R124.2 U1.16 U21.10 U22.8 U22.13 U29.4 U29.5
VDDA: C3.1 C4.1 L3.1 U1.5
BLUE_BRTS: U1.11 U21.16
BLUE_LINK: U1.10 U21.6
BLUE_RX: U1.8 U21.8
BLUE_TX: U1.9 U21.9
CHRG: R91.1 U11.7
MPU_AD0: R98.1 U1.17
MPU_INT: R97.1 U1.14
MPU_SCL: R94.2 R96.1 U1.13
MPU_SDA: R93.2 R95.1 U1.12
POWER_ADC: C96.2 R113.2 R114.2 U1.6
RESET: C32.2 R25.1 SW3.3 U1.4
STDBY: R92.1 U11.6
SWCLK: H1.2 U1.20
SWDIO: H1.1 U1.19
$1N704: R93.1 U22.24
$1N709: R94.1 U22.23
$1N710: R97.2 U22.12
$1N715: C83.1 U22.20
$1N717: C82.2 U22.10
$1N722: R98.2 R99.1 U22.9
$1N1384: R3.2 U11.2
$1N1396: LED2.1 R91.2
$1N1399: LED3.1 R92.2
$1N1588: R120.1 USB2.A5
$1N1590: R121.1 USB2.B5
$1N2815: R122.1 U1.1
$1N3245: Q1.3 SW2.1
$1N4929: C101.1 U29.1 U29.12 U29.13
$1N4931: R123.2 U29.14
$1N4935: R124.1 R125.2 U29.3
$1N4936: L8.2 U29.8 U29.9
$1N4937: L8.1 U29.6 U29.7

Pads without a net: SW2 3; SW3 2 4; U1 2 3 7 18; U21 1 3 4 5 7 12 13 14 15 17 18; U22 2 3 4 5 6 7 14 15 16 17 19 21 22 25; USB2 A6 A7 A8 B6 B7 B8

## Via types
v1: diameter 0.508, hole 0.305, Top Layer to Bottom Layer, 45 vias
v2: diameter 0.508, hole 0.3, Top Layer to Bottom Layer, 12 vias
v3: diameter 0.61, hole 0.305, Top Layer to Bottom Layer, 5 vias

## Routing (per net, layer and track width the routed paths; a pad name or vN(x,y) marks a point on that pad's centre or on a via; arc(x,y) is an arc through that point)
5V: length 36
  Top Layer w0.254: R113.1 33.76,7.78 v1(33.76,9.02) ; Q1.2 21.27,15.35 21.44,15.52 v1(30.02,15.52)
  Top Layer w0.508: C99.1 C100.1 19.06,5.52 18.8,5.79 18.8,7.62 19.3,8.13 21.34,8.13 21.84,8.64 21.84,11.97 D1.1 21.27,12.54 Q1.2
  Bottom Layer w0.254: v1(30.02,15.52) 30.02,9.32 30.33,9.02 v1(33.76,9.02)
GND: length 66
  Top Layer w0.254: v1(40.05,9.02) 40.05,7.82 ; 10.55,11.28 14.92,11.28 ; R114.1 v2(33.86,5.19) 33.86,2.57 R122.2 ; 15.3,11.28 15.05,11.28 U11.9 ; v1(37.69,16.64) U22.1 ; C83.2 41.02,10.06 v1(41.02,9.65) ; v1(31.88,11.18) 31.88,10.97 C84.1 ; v1(37.68,10.54) U22.18 ; R125.1 v1(28.37,1.02) ; U29.2 26.2,4.13 U29.15 ; C101.2 v1(25.85,0.81) ; v1(33.53,12.86) U22.11
  Top Layer w0.508: 57.82,12.96 v1(57.82,14.35) ; 55.62,5.33 v1(54.23,5.33) ; v2(59.44,5.33) U21.11 ; 10.39,7.56 12.07,7.56 ; v1(17.53,16.13) 17.53,14.61 ; C82.1 v2(31.31,14.61) 31.31,15.29 R99.2 ; USB2.B1A12 8.06,4.99 USB2.0 ; v1(13.33,16.5) R3.1 14.98,16.26 U11.3 ; USB2.A1B12 8.06,12.03 7.26,12.83 ; 58.04,5.47 v1(58.04,6.86) ; v1(24.77,7.8) 24.77,5.57 U29.15 ; v1(25.63,7.77) 25.63,5.34 25.31,5.02 ; v1(58.54,7.87) 58.54,9.27 ; C100.2 C99.2 22.38,7.09 v1(22.38,7.9) ; 45.22,12.95 v1(46.61,12.95) ; 100NF.2 v1(31.29,7.3) 31.87,7.3 ; R4.1 v1(20.91,11.3)
  Bottom Layer w0.254: C4.2 C3.2 36.31,1.26 v1(36.07,1.02)
  Bottom Layer w0.508: v1(3.06,7.11) 3.06,5.72 v1(1.52,5.72) ; 7.26,12.83 6.5,12.83 R120.2 ; USB2.0 6.04,4.19 R121.2
  vias: v1(13.21,7.56) v1(31.88,7.31) v2(14.48,12.83) v2(14.48,11.3) v2(15.49,12.83) v2(15.5,11.3) v2(16.58,12.83) v2(16.57,11.3)
VBAT: length 24.4
  Top Layer w0.508: v3(10.41,10.03) 10.41,8.98 10.44,8.95 10.77,8.95 ; 10.77,8.95 12.45,8.95 ; 10.77,8.95 10.9,9.08 ; 12.45,8.95 12.58,9.08 ; 12.45,8.95 13.6,8.95 U11.5
  Bottom Layer w0.508: TP10.1 2.07,8.72 1.4,9.4 1.4,13.59 1.78,13.97 4.95,13.97 5.46,14.48 5.46,16.13 ; v3(10.41,10.03) 9.02,10.03 7.7,8.72 3.75,8.72 3.62,8.85
VBUS: length 37.1
  Top Layer w0.508: 11.67,4.34 11.68,4.36 11.68,5.72 11.29,6.11 9.14,6.11 ; 11.67,4.34 LED2.2 ; 11.67,4.34 11.67,4.83 ; 9.14,6.11 9.14,10.91 ; 9.14,6.11 USB2.B4A9 ; 9.14,10.91 USB2.A4B9 ; 9.14,10.91 9.14,12.32 9.4,12.57 11.95,12.57 C25.2 12.07,14.48 12.45,14.86 13.7,14.86 U11.4 ; 19.88,14.45 19.36,14.45 19.3,14.39 v3(19.3,15.62) ; U11.8 19.14,8.85 19.43,9.14 19.43,10.38 R4.2 19.37,10.44 Q1.1
  Bottom Layer w0.508: v3(12.64,14.86) 18.54,14.86 v3(19.3,15.62)
VCC3V3: length 22
  Top Layer w0.158: R96.2 40.48,12.22 40.64,12.06 v1(40.64,11.43) ; v2(39.97,17.96) R95.2 ; v2(33.78,16.13) 33.78,14.48 33.9,14.36 U22.8
  Top Layer w0.254: 32.73,10.41 C84.2 ; 32.73,10.41 32.73,11.01 33.02,11.3 v1(33.91,11.3) ; 32.73,10.41 34.8,10.41 35.19,10.8 U22.13 ; v1(58.93,11.94) 58.44,11.45 R25.2 ; 39.4,7.82 39.4,5.23 v1(39.37,5.21) ; R123.1 v1(20.58,2.44)
  Top Layer w0.508: U21.10 v2(59.01,4.06) v1(59.56,4.06)
  Bottom Layer w0.254: v1(39.37,5.21) 39.37,6.21 C86.2 ; v1(43.43,1.26) L3.2
  vias: v1(31.57,6.12) v1(31.57,5.45) v1(31.57,4.76) v1(31.57,4.09)
VDDA: length 8.1
  Top Layer w0.254: v1(39.4,3.68) 39.4,1.82
  Bottom Layer w0.254: 37.59,2.74 C3.1 ; 37.59,2.74 40.99,2.74 L3.1 ; 37.59,2.74 37.59,3.43 37.85,3.68 v1(39.4,3.68)
BLUE_BRTS: length 16.9
  Top Layer w0.158: U21.16 54.23,11.68 53.85,11.3 v1(53.85,7.82) ; v1(43.31,7.82) 42.65,7.82
  Bottom Layer w0.158: v1(43.31,7.82) v1(53.85,7.82)
BLUE_LINK: length 11.4
  Top Layer w0.158: 42.65,1.82 42.65,2.9 42.8,3.05 46.36,3.05 46.74,3.43 46.74,7.49 46.36,7.87 U21.6
BLUE_RX: length 6.7
  Top Layer w0.158: U21.8 42.04,5.33 41.35,4.64 41.35,1.82
BLUE_TX: length 4.9
  Top Layer w0.158: 42,1.82 42,3.64 42.42,4.06 U21.9
CHRG: length 7.7
  Top Layer w0.254: U11.7 16.25,7.12 16.51,6.86 17.14,6.86 17.4,6.6 17.4,3.17 17.14,2.92 16.37,2.92
MPU_AD0: length 18.1
  Top Layer w0.158: v1(38.37,17.78) 31.37,17.78 31.11,17.53 31.11,17.04 R98.1 ; 38.75,7.82 38.73,7.83 v1(38.73,9.02)
  Bottom Layer w0.158: v1(38.37,17.78) 38.73,17.41 v1(38.73,9.02)
MPU_INT: length 14.7
  Top Layer w0.158: R97.1 30.88,12.08 30.48,11.68 30.48,9.68 30.64,9.53 40.39,9.53 40.7,9.21 40.7,7.82
MPU_SCL: length 7.3
  Top Layer w0.158: 41.48,13.8 41.48,12.22 42.01,12.22 42.29,11.94 42.29,9.56 42.13,9.4 41.66,9.4 41.35,9.09 41.35,7.82
MPU_SDA: length 10.6
  Top Layer w0.158: 41.48,16.95 41.48,15.37 42.54,15.37 42.8,15.11 42.8,9.4 42,8.6 42,7.82
POWER_ADC: length 10.4
  Top Layer w0.158: 35.36,4.3 C96.2 ; 35.36,4.3 R113.2 ; 35.36,4.3 39.65,4.3 40.05,3.9 40.05,1.82
RESET: length 34.4
  Top Layer w0.158: SW3.3 60.07,12.8 60.07,1.27 59.31,0.51 38.99,0.51 38.75,0.75 38.75,1.82
STDBY: length 5
  Top Layer w0.254: U11.6 14.98,6.61 15.37,6.22 16,6.22 16.38,5.84 16.38,4.85 16.37,4.84
SWCLK: length 35.4
  Top Layer w0.158: 36.8,7.82 36.8,7.81 v1(36.8,6.35)
  Bottom Layer w0.158: H1.2 6.79,2.55 7.19,2.95 35.81,2.95 36.07,3.2 36.07,5.61 v1(36.8,6.35)
SWDIO: length 33.9
  Top Layer w0.158: v1(37.46,5.84) 37.46,7.8 U1.19
  Bottom Layer w0.158: H1.1 36.3,1.65 36.8,2.16 36.8,5.61 37.01,5.82 37.44,5.82 v1(37.46,5.84)
$1N704: length 1.7
  Top Layer w0.158: U22.24 38.86,14.86 39.38,15.37 R93.1
$1N709: length 1.8
  Top Layer w0.158: R94.1 39.42,13.8 38.85,14.36 U22.23
$1N710: length 1.9
  Top Layer w0.158: U22.12 33.82,12.36 33.53,12.06 32.71,12.06 R97.2
$1N715: length 3.7
  Top Layer w0.158: U22.20 38.96,12.86 39.12,12.7 39.12,10.8 39.37,10.54 40.09,10.54 C83.1
$1N717: length 1.9
  Top Layer w0.158: U22.10 33.76,13.36 33.37,13.74 C82.2
$1N722: length 4.5
  Top Layer w0.158: R98.2 R99.1 32.73,15.37 33.24,15.37 33.4,15.21 33.4,14.22 33.77,13.86 U22.9
$1N1384: length 1.8
  Top Layer w0.508: U11.2 16.25,16.63
$1N1396: length 1.6
  Top Layer w0.254: R91.2 14.85,2.93 LED2.1
$1N1399: length 1.6
  Top Layer w0.254: LED3.1 R92.2
$1N1588: length 3.4
  Top Layer w0.254: v3(6.35,9.76) 8.44,9.76
  Bottom Layer w0.254: 5.09,9.66 5.21,9.78 6.35,9.78 v3(6.35,9.76)
$1N1590: length 3.4
  Top Layer w0.254: v3(6.35,6.76) 8.44,6.76
  Bottom Layer w0.254: 5.08,6.79 5.11,6.76 v3(6.35,6.76)
$1N2815: length 1.7
  Top Layer w0.158: R122.1 36.08,2.54 36.8,1.82
$1N3245: length 18.8
  Top Layer w0.508: Q1.3 20.32,17.53 19.94,17.91 11.81,17.91 11.43,17.53 11.43,14.73 10.8,14.1 8.13,14.1 7.46,14.76 7.46,16.13
$1N4929: length 16.6
  Top Layer w0.254: U29.12 23.05,4.63 22.82,4.41 ; U29.1 26.65,2.77 26.44,2.57 24.61,2.57 24.43,2.39 24.43,1.77 C101.1 24.44,1.75 19.79,1.75 19.46,2.08 19.46,4.15 19.71,4.41 22.82,4.41 ; U29.13 23.74,4.14 23.09,4.14 22.82,4.41
$1N4931: length 1.7
  Top Layer w0.254: R123.2 22.13,3.63 U29.14
$1N4935: length 4.3
  Top Layer w0.254: R124.1 29.95,2.73 28.45,4.23 27.59,4.23 27.19,4.63 U29.3
$1N4936: length 5
  Top Layer w0.508: U29.8 23.75,11.38 L8.2
$1N4937: length 5.6
  Top Layer w0.508: L8.1 27.61,10.9 27.61,8.31 26.65,7.34 U29.7

## Copper pours and planes (outline as drawn; the poured copper is in the pictures)
5V on Top Layer: 21.5,6.05 24.16,6.05 24.16,4.95 21.5,4.95
GND on Top Layer: 4.95,20.83 64.01,20.83 64.01,-2.03 4.95,-2.03
GND on Bottom Layer: 6.48,19.94 64.9,19.94 64.9,-1.14 6.48,-1.14
GND on Inner1: 0.26,18.41 60.7,18.41 60.7,0.26 0.26,0.26
VCC3V3 on Top Layer: 26.24,6.45 32.28,6.45 32.28,3.68 26.24,3.68
VCC3V3 on Inner2: 0.26,18.41 60.7,18.41 60.7,0.26 0.26,0.26

Small or netless copper shapes (teardrops, artwork), in the pictures only: 213 on Top Layer, 38 on Bottom Layer, 25 on Inner1, 4 on Inner2

## Text on the board
Bottom Silkscreen Layer: VCC | GND
Top Silkscreen Layer: G | DIO

# Board PCB2
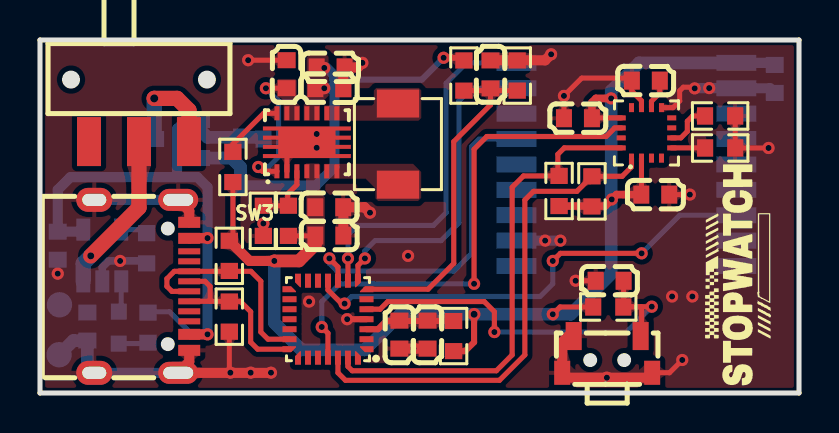
[diagram p4: board, top side]
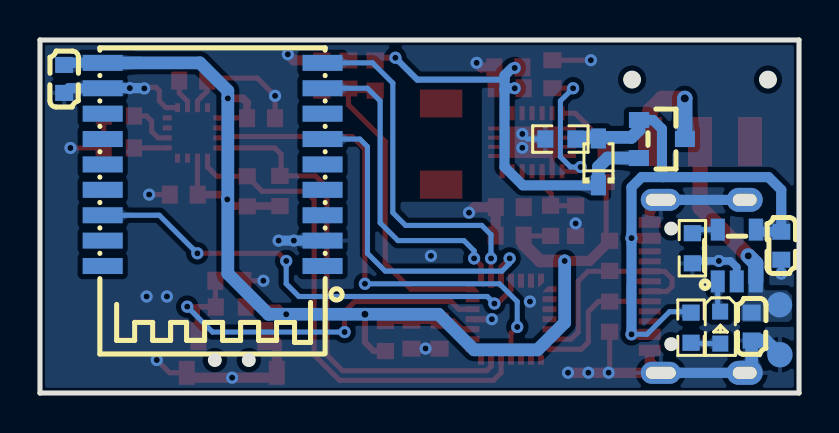
[diagram p5: board, bottom side, seen from below]

Outline 37.97 x 17.65 mm; copper layers: Top Layer, Bottom Layer. Coordinates in mm from the lower left corner of the outline.
Outline path: 0,17.65 0,0 37.97,0 37.97,17.65 0,17.65
Stack: Top Layer 0.035mm / Dielectric1 1.51mm FR4 er 4.5 / Bottom Layer 0.035mm

## Design rules (mm)
template: JLCPCB Capability(Two Layers Board)
spacing copperThickness1oz (default): track to track 0.102, other pairs 0.152 to 0.3
spacing copperThickness2oz: track to track 0.203, other pairs 0.152 to 0.3
track width copperThickness1oz (default): min 0.127, default 0.254, max 2.54
track width copperThickness2oz: min 0.203, default 0.254, max 2.54
differential pair differentialPair (default): width min 0.127, default 0.254, max 2.54; gap min 0.152, default 0.152
via viaSize (default): diameter min 0.5, default 0.61, max 10; hole min 0.3, default 0.305, max 6.3

## Placement (name value [footprint] x y rotation side)
C3  100nF  [C0603]  28.5 5.61 0 top
C6  100nF  [C0603]  36.76 15.71 90 bottom
C8  4.7uF  [C0603]  0.89 7.37 270 bottom
C9  10uF  [C0603]  2.37 3.32 270 bottom
C10  100nF  [C0603]  22.54 15.93 270 top
C11  100nF  [C0603]  12.34 15.94 90 top
C12  10uF  [C0603]  14.48 15.24 0 top
C13  100nF  [C0603]  14.54 16.28 0 top
C14  100nF  [C0603]  14.47 9.29 0 top
C15  10uF  [C0603]  14.48 7.87 0 top
C16  100nF  [C0603]  17.98 2.92 90 top
C17  100nF  [C0603]  19.39 2.92 90 top
C109  4.7uF  [C0603]  30.31 15.62 0 top
C111  100nF  [C0603]  30.78 9.92 180 top
C112  100nF  [C0603]  26.91 13.74 0 top
D1  1N5819WS  [SOD-323_L1.8-W1.3-LS2.5-RD]  10.03 11.56 90 bottom
L1  2.2uH  [IND-SMD_L4.4-W4.2]  17.91 12.45 270 top
LED1  -  [LED_0603]  3.93 3.22 270 bottom
Q1  AO3401A  [SOT-23_L2.9-W1.3-P1.90-LS2.4-BR]  6.86 12.7 0 bottom
R3  10K  [R0603]  28.43 4.3 180 top
R10  10K  [R0603]  9.47 6.86 90 top
R11  10K  [R0603]  9.47 3.82 270 top
R12  2K  [R0603]  5.33 7.24 90 bottom
R13  1K  [R0603]  5.4 3.27 270 bottom
R14  10kΩ  [R0603]  11.94 12.7 180 bottom
R15  5K  [R0603]  21.21 15.88 270 top
R16  20K  [R0603]  23.88 15.88 270 top
R17  1M  [R0603]  9.65 11.3 90 top
R18  1M  [R0603]  12.43 8.61 270 top
R19  180K  [R0603]  11.18 8.61 90 top
R20  10K  [R0603]  20.69 2.85 270 top
R127  4.7K  [R0603]  25.97 10.1 270 top
R128  4.7K  [R0603]  27.61 10.08 90 top
R129  4.7K  [R0603]  34.03 12.25 0 top
R130  4.7K  [R0603]  34.03 13.85 180 top
SW1  TS24CA 250gf 013  [SW-SMD_L4.7-W3.5-P3.35-EH]  28.38 1.93 180 top
SW3  TA-3525-A2  [SW-SMD_3P-L9.1-W3.5-P2.50-EH6.8]  4.95 12.57 180 top
TP1  -  [Test-Point-0.5mm]  0.98 4.41 180 bottom
TP2  -  [Test-Point-0.5mm]  0.96 1.91 270 bottom
U1  STM32G031G8U6  [UFQFPN-28_L4.0-W4.0-P0.50-BL]  14.41 3.69 90 top
U2  RC6621A  [BULETM-SMD_18P-L15.2-W11.2-P1.27]  29.34 11.43 0 bottom
U4  TP4054  [TSOT-23-5_L2.9-W1.6-P0.95-LS2.8-BR]  3.11 6.88 270 bottom
U5  TPS63020DSJR  [VSON-14_L4.0-W3.0-P0.50-BL-EP_TI_DSJ]  13.35 12.54 0 top
U32  IST8310  [LGA-16_L3.0-W3.0-P0.50-BL_SQ]  30.34 13.01 0 top
USB1  TYPE-C 16PIN 2MD(073)  [USB-C-SMD_TYPE-C-6PIN-2MD-073]  5.09 5.33 270 top

## Footprints (pads in the part's own frame, mm; a bottom-side part is the same pattern mirrored in y, then rotated)
BULETM-SMD_18P-L15.2-W11.2-P1.27
  rect 2x0.8 smd: 1(-5.5,5.08) 2(-5.5,3.81) 3(-5.5,2.54) 4(-5.5,1.27) 5(-5.5,0) 6(-5.5,-1.27) 7(-5.5,-2.54) 8(-5.5,-3.81) 9(-5.5,-5.08) 10(5.5,-5.08) 11(5.5,-3.81) 12(5.5,-2.54) 13(5.5,-1.27) 14(5.5,0) 15(5.5,1.27) 16(5.5,2.54) 17(5.5,3.81) 18(5.5,5.08)
C0603
  rect 0.8x0.9 smd: 1(-0.7,0) 2(0.7,0)
IND-SMD_L4.4-W4.2
  rect 1.4x2.12 smd: 1(2.028,0) 2(-2.028,0)
LED_0603
  rect 0.8x0.8 smd: 1(-0.851,-0.01) 2(0.75,-0.005)
LGA-16_L3.0-W3.0-P0.50-BL_SQ
  rect 0.25x0.45 smd: 1(-0.75,-1.263) 2(-0.25,-1.263) 3(0.25,-1.263) 4(0.75,-1.263) 9(0.75,1.263) 10(0.25,1.263) 11(-0.25,1.263) 12(-0.75,1.263)
  rect 0.45x0.25 smd: 5(1.263,-0.75) 6(1.263,-0.25) 7(1.263,0.25) 8(1.263,0.75) 13(-1.263,0.75) 14(-1.263,0.25) 15(-1.263,-0.25) 16(-1.263,-0.75)
R0603
  rect 0.806x0.864 smd: 1(-0.753,0) 2(0.753,0)
SOD-323_L1.8-W1.3-LS2.5-RD
  rect 1x0.75 smd: 1(-1.173,0) 2(1.173,0)
SOT-23_L2.9-W1.3-P1.90-LS2.4-BR
  rect 1x0.8 smd: 1(1.15,-0.95) 2(1.15,0.95) 3(-1.15,0)
SW-SMD_3P-L9.1-W3.5-P2.50-EH6.8
  rect 1.2x2.45 smd: 1(-2.5,0) 2(0,0) 3(2.5,0)
SW-SMD_L4.7-W3.5-P3.35-EH
  rect 0.8x1.4 smd: 1(-1.675,-0.917) 2(1.675,-0.917)
  rect 0.8x1.2 smd: 3(-2.25,0.917) 4(2.25,0.917)
Test-Point-0.5mm
  round 1.27 smd: 1(0,0)
TSOT-23-5_L2.9-W1.6-P0.95-LS2.8-BR
  rect 1.1x0.7 smd: 1(1.294,-0.951) 2(1.294,-0.001) 3(1.294,0.951) 4(-1.294,0.951) 5(-1.294,-0.949)
UFQFPN-28_L4.0-W4.0-P0.50-BL
  custom 0.3x0.675 smd: 1(-1.5,-1.875) 7(1.5,-1.875) 15(1.5,1.875) 21(-1.5,1.875)
  rect 0.3x0.7 smd: 2(-1,-1.925) 3(-0.5,-1.925) 4(0,-1.925) 5(0.5,-1.925) 6(1,-1.925) 16(1,1.925) 17(0.5,1.925) 18(0,1.925) 19(-0.5,1.925) 20(-1,1.925)
  custom 0.675x0.3 smd: 8(1.875,-1.5) 14(1.875,1.5) 22(-1.875,1.5) 28(-1.875,-1.5)
  rect 0.7x0.3 smd: 9(1.925,-1) 10(1.925,-0.5) 11(1.925,0) 12(1.925,0.5) 13(1.925,1) 24(-1.925,0.5) 25(-1.925,0) 26(-1.925,-0.5) 27(-1.925,-1)
  custom 0.7x0.3 smd: 23(-1.925,1)
USB-C-SMD_TYPE-C-6PIN-2MD-073
  rect 0.55x1.1 smd: 1(-3.2,2.375) 2(-2.4,2.375) 11(2.4,2.375) 12(3.2,2.375)
  rect 0.3x1.1 smd: 3(-1.75,2.375) 4(-1.25,2.375) 5(-0.75,2.375) 6(-0.25,2.375) 7(0.25,2.375) 8(0.75,2.375) 9(1.25,2.375) 10(1.75,2.375)
  oval 1.1x2 hole 0.6x1.5: 13(-4.325,1.825) 14(4.325,1.825)
  oval 1.2x1.8 hole 0.6x1.2: 13(-4.325,-2.375) 14(4.325,-2.375)
VSON-14_L4.0-W3.0-P0.50-BL-EP_TI_DSJ
  rect 0.25x0.7 smd: 1(-1.5,-1.45) 2(-1,-1.45) 3(-0.5,-1.45) 4(0,-1.45) 5(0.5,-1.45) 6(1,-1.45) 7(1.5,-1.45) 8(1.5,1.45) 9(1,1.45) 10(0.5,1.45) 11(0,1.45) 12(-0.5,1.45) 13(-1,1.45) 14(-1.5,1.45)
  custom 4.4x1.58 smd: 15(0,0)

## Nets
As in the schematic.

Pads without a net: SW3 3; U1 1 2 6 12 13 14 15 16 17 18 19 22 23 24 28; U2 1 3 4 5 7 12 13 14 15 17 18; U32 3 4 7 8 12 15; USB1 3 4 9 10

## Via types
v1: diameter 0.61, hole 0.305, Top Layer to Bottom Layer, 48 vias
v2: diameter 0.635, hole 0.355, Top Layer to Bottom Layer, 2 vias
v3: diameter 0.635, hole 0.305, Top Layer to Bottom Layer, 1 via
v4: diameter 0.762, hole 0.406, Top Layer to Bottom Layer, 1 via

## Routing (per net, layer and track width the routed paths; a pad name or vN(x,y) marks a point on that pad's centre or on a via; arc(x,y) is an arc through that point)
5V: length 21.6
  Top Layer w0.254: C13.1 14.2,16.28 v1(14.22,16.26)
  Top Layer w0.305: v1(20.19,16.76) 21.17,16.76 21.21,16.81
  Top Layer w0.508: v1(14.22,15.24) C12.1
  Bottom Layer w0.305: 14.73,15.67 19.1,15.67 v1(20.19,16.76)
  Bottom Layer w0.508: 14.73,15.18 14.73,11.3 13.81,10.38 D1.1 ; 14.73,15.18 14.73,15.88 14.35,16.26 ; 14.73,15.18 14.67,15.24 v1(14.22,15.24)
  Bottom Layer w0.635: Q1.2 9.59,11.75 10.03,11.3 D1.1
GND: length 70.9
  Top Layer w0.254: U5.15 12.54,12.54 12.35,12.35 U5.2 ; v1(9.53,1.02) 9.47,1.07 9.47,3.07 ; 26.21,13.74 v1(26.21,14.86) 27.1,15.75 29.48,15.75 C109.1 29.61,15.09 30.09,14.61 U32.11 ; v1(32.75,15.23) 32.69,15.29 32.18,15.29 32,15.11 32,14.61 31.67,14.27 U32.9 ; C111.1 v1(32.51,9.92) ; C11.2 v1(10.41,16.64) ; R19.1 v1(11.18,8.48) ; SW1.3 31.49,1.01 v1(32.13,1.65) ; C3.1 v1(26.8,5.61) ; v1(36.45,12.25) R129.2 34.78,13.85 R130.1
  Top Layer w0.305: U1.4 v1(15.37,3.69)
  Top Layer w0.508: v1(16.13,16.51) 15.9,16.28 C13.2 15.18,16.22 C12.2 ; 22.54,16.63 22.55,16.64 25.27,16.64 v1(25.57,16.94) ; USB1.1 7.47,9.11 USB1.13 ; USB1.12 7.47,1.56 USB1.14 11.55,1.01 v1(11.56,1.02) ; C15.2 15.18,9.28 C14.2 16.24,9.29 v1(16.51,9.02) ; SW1.3 30.38,0.77 v1(28.36,0.77) 26.37,0.77 SW1.4 26.12,2.54 26.43,2.85 SW1.2 ; C16.1 C17.1
  Bottom Layer w0.254: C8.2 v1(0.89,5.97) ; v1(13.84,12.95) 13.59,12.7 R14.1
  Bottom Layer w0.381: U4.2 3.12,6.29 3.43,6.6 v1(4.01,6.6) 5.22,6.6 R12.1
  Bottom Layer w0.508: USB1.14 USB1.14 ; v1(32.75,15.23) 32.77,15.25 v1(33.48,15.25) 34.83,15.25 U2.11 36.53,15.24 C6.1 ; U2.2 v1(25.27,7.62) v1(26.03,7.62) ; USB1.13 USB1.13
  Bottom Layer w0.635: TP2.1 1.67,2.62 2.37,2.62 2.37,1.35 USB1.14
  vias: v1(10.54,1.02) v1(13.46,4.57) v1(13.84,12.26) v1(18.41,6.86) v1(18.68,2.22) v1(31.62,4.83) v1(32.64,4.83)
VBAT: length 8.1
  Top Layer w0.762: SW3.2 4.95,9.27 v2(2.54,6.86)
  Bottom Layer w0.762: U4.3 2.16,6.48 v2(2.54,6.86)
VBUS: length 31.7
  Top Layer w0.508: USB1.2 7.48,7.75 v1(8.38,7.75) ; USB1.11 v1(8.38,2.93)
  Bottom Layer w0.254: v1(8.38,2.93) 7.61,2.93 6.48,4.06 5.45,4.06 R13.1
  Bottom Layer w0.508: 6.78,10.8 1.52,10.8 0.89,10.16 C8.1 2.06,8.07 U4.4 ; 6.78,10.8 7.87,10.8 8.38,10.29 v1(8.38,7.75) v1(8.38,2.93) ; 6.78,10.8 6.86,10.87 6.86,13.21 7.3,13.65 Q1.1
  Bottom Layer w0.635: R14.2 11.1,12.78 8.38,12.78 8.01,13.16 Q1.1
VCC3V3: length 64.2
  Top Layer w0.254: 27.61,13.82 27.67,13.76 U32.13 ; R17.1 9.65,7.79 R10.2 ; v1(25.65,3.94) 26.02,4.3 R3.2 ; R18.2 13.76,7.86 C15.1 ; U32.2 30.09,9.93 C111.2
  Top Layer w0.305: 20.69,2.09 21.27,2.09 21.72,2.54 v2(21.72,3.94)
  Top Layer w0.381: R127.2 28.27,9.35 v1(28.6,9.68) 28.85,9.92 C111.2 ; v1(28.57,14.73) 27.81,14.73 27.61,14.53 C112.2
  Top Layer w0.508: v3(11.72,6.6) 10.48,6.6 R10.2
  Top Layer w0.635: C15.1 13.78,7.43 12.95,6.6 v3(11.72,6.6)
  Bottom Layer w0.508: C6.2 36.66,16.51 U2.10
  Bottom Layer w0.635: U2.10 29.97,16.51 28.57,15.11 v1(28.57,14.73) 28.57,5.97 26.54,3.94 v1(25.65,3.94) v2(21.72,3.94) 18.03,3.94 16.26,2.16 13.08,2.16 11.72,3.52 v3(11.72,6.6)
VDDA: length 4.5
  Top Layer w0.305: U1.3 16.91,3.19 17.32,3.6 R20.1
BLUE_LINK: length 16.9
  Top Layer w0.254: v1(14.48,6.73) 14.91,6.3 U1.10
  Bottom Layer w0.254: U2.6 21.97,12.7 21.59,12.32 21.59,6.98 20.7,6.1 14.86,6.1 14.48,6.48 v1(14.48,6.73)
BLUE_RTS: length 23.7
  Top Layer w0.254: v1(15.24,4.47) 15.09,4.47 14.41,5.15 U1.11 ; v1(25.65,6.6) 26.03,6.98 v1(30.1,6.98)
  Bottom Layer w0.254: v1(25.65,6.6) 25.65,5.46 25.02,4.83 15.6,4.83 v1(15.24,4.47) ; v1(30.1,6.98) 32,8.89 U2.16
BLUE_RX: length 16.2
  Top Layer w0.254: U1.8 15.91,6.38 v1(16.26,6.73)
  Bottom Layer w0.254: v1(16.26,6.73) 16.26,7.11 16.76,7.62 20.07,7.62 20.96,8.51 20.96,14.61 21.59,15.24 U2.8
BLUE_TX: length 18.1
  Top Layer w0.254: U1.9 v1(15.41,6.73)
  Bottom Layer w0.254: v1(15.41,6.73) 15.41,7.92 15.88,8.38 19.69,8.38 20.32,9.02 20.32,15.49 21.34,16.51 U2.9
IST_RST: length 25.5
  Top Layer w0.254: U32.14 28.75,13.26 28.32,12.83 22.35,12.83 21.72,12.19 v1(21.72,5.46) ; U1.25 14.41,2.99 v1(14.1,3.3)
  Bottom Layer w0.254: v1(21.72,5.46) 14.99,5.46 14.1,4.57 v1(14.1,3.3)
IST_SCL: length 25
  Top Layer w0.254: U32.1 29.59,11.3 29.12,10.84 R128.2 26.86,10.08 24.69,10.08 24.26,9.65 24.26,1.91 22.99,0.64 15.28,0.64 14.91,1.01 U1.26
IST_SDA: length 24.4
  Top Layer w0.254: U32.16 26.23,12.26 25.91,11.94 25.91,10.92 R127.1 24.19,10.86 23.62,10.29 23.62,1.91 22.83,1.11 15.62,1.11 15.41,1.33 U1.27
POWER_ADC: length 17.1
  Top Layer w0.254: R15.2 22.54,15.12 ; 22.54,15.12 R16.2 ; 22.54,15.12 22.54,14.41 20.7,12.57 20.7,6.48 19.41,5.19 U1.7 ; 22.54,15.12 C10.2
REST: length 21.3
  Top Layer w0.254: v1(30.61,4.32) 29.2,4.32 ; U1.5 17.02,4.19 17.4,4.57 22.22,4.57 22.73,4.06 v1(22.73,3.05) ; C3.2 29.2,4.32 29.18,4.3 30.1,4.3 30.1,2.9 SW1.1
  Bottom Layer w0.254: v1(30.61,4.32) 29.34,3.05 v1(22.73,3.05)
SWCLK: length 8.8
  Top Layer w0.254: 8.51,4.58 10.02,4.58 10.54,4.06 10.54,2.54 10.89,2.19 U1.21 ; 8.51,4.58 8.51,5.33 8.26,5.58 USB1.6 ; 8.51,4.58 USB1.8
SWDIO: length 10.8
  Top Layer w0.254: USB1.7 7.46,5.08 6.6,5.08 6.35,5.33 6.35,5.72 6.72,6.08 USB1.5 10.55,6.08 11.05,5.59 11.05,3.05 11.41,2.69 12.48,2.69
$1N9447: length 1.5
  Top Layer w0.254: U32.10 30.59,14.59 31.01,15.01 C109.2
$1N9455: length 1.7
  Top Layer w0.254: 33.28,12.2 33.22,12.26 31.6,12.26
$1N9456: length 2.4
  Top Layer w0.254: R130.2 32.65,13.85 32.38,13.59 32.38,13.08 32.06,12.76 31.6,12.76
$2N1610: length 5.6
  Top Layer w0.762: SW3.1 7.45,14.14 6.86,14.73 v4(5.72,14.73)
  Bottom Layer w0.762: v4(5.72,14.73) 5.72,12.71 Q1.3
$2N2157: length 1.6
  Bottom Layer w0.254: LED1.1 4.06,4.19 U4.1
$2N2861: length 3.3
  Top Layer w0.254: 12.39,9.25 12.39,9.36 ; 12.39,9.36 R19.2 ; 12.39,9.36 12.39,9.96 12.85,10.42 U5.3
$2N2863: length 7
  Top Layer w0.254: v1(10.92,11.3) 11.14,11.09 U5.1 ; C11.1 11.31,15.24 v1(11.3,15.24)
  Bottom Layer w0.254: v1(10.92,11.3) 11.43,11.3 11.94,11.81 11.94,14.61 v1(11.3,15.24)
$2N2864: length 3.1
  Top Layer w0.254: 11.76,13.99 11.19,13.99 9.65,12.45 R17.2
$2N2929: length 1.3
  Bottom Layer w0.254: R12.2 5.16,8.17 U4.5
$2N2958: length 1.5
  Bottom Layer w0.254: R13.2 5.36,2.47 LED1.2

## Copper pours and planes (outline as drawn; the poured copper is in the pictures)
5V on Top Layer: 13.2,16.94 14.44,16.94 14.44,13.62 13.2,13.62
GND on Top Layer: -2.29,20.19 39.5,20.19 39.5,-1.65 -2.29,-1.65
GND on Bottom Layer: -1.4,20.95 39.37,20.95 39.37,-2.29 -1.4,-2.29
VBAT on Bottom Layer: 0.35,6.27 2.92,6.27 2.92,3.56 0.35,3.56
VCC3V3 on Top Layer: 13.32,11.48 14.25,11.48 14.25,7.29 13.32,7.29
$2N2863 on Top Layer: 11.85,15.71 13.01,15.71 13.01,13.62 11.85,13.62
$2N2865 on Top Layer: 14.22,15.25 19.07,15.25 19.07,13.61 14.22,13.61
$2N2870 on Top Layer: 14.2,11.46 19.07,11.46 19.07,9.6 14.2,9.6

Small or netless copper shapes (teardrops, artwork), in the pictures only: 132 on Top Layer, 67 on Bottom Layer
